# Altium schematic sheet Top.SchDoc
size A4; SheetNumber: 2; SheetTotal: 2
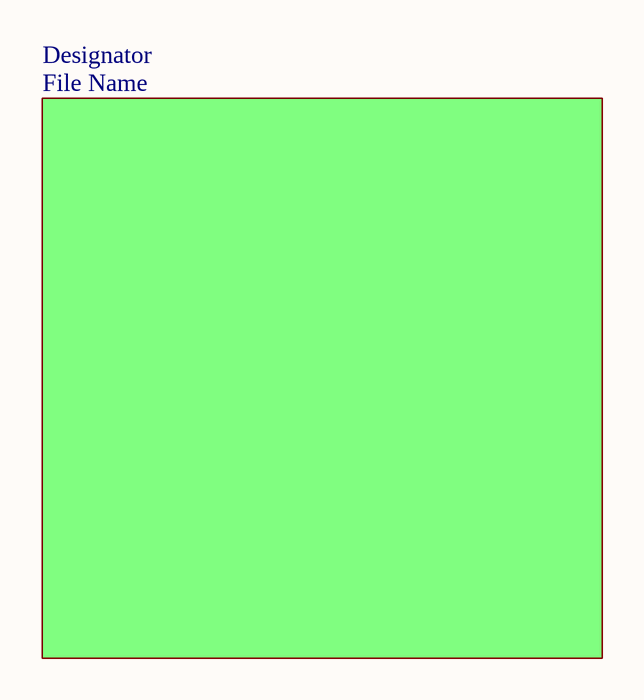
[diagram p0: Top.SchDoc]

## Sub-sheets
Designator = File Name: no entries